# EAGLE design Easy Mikrobus XIAO 230926 (EAGLE 6.5.0)
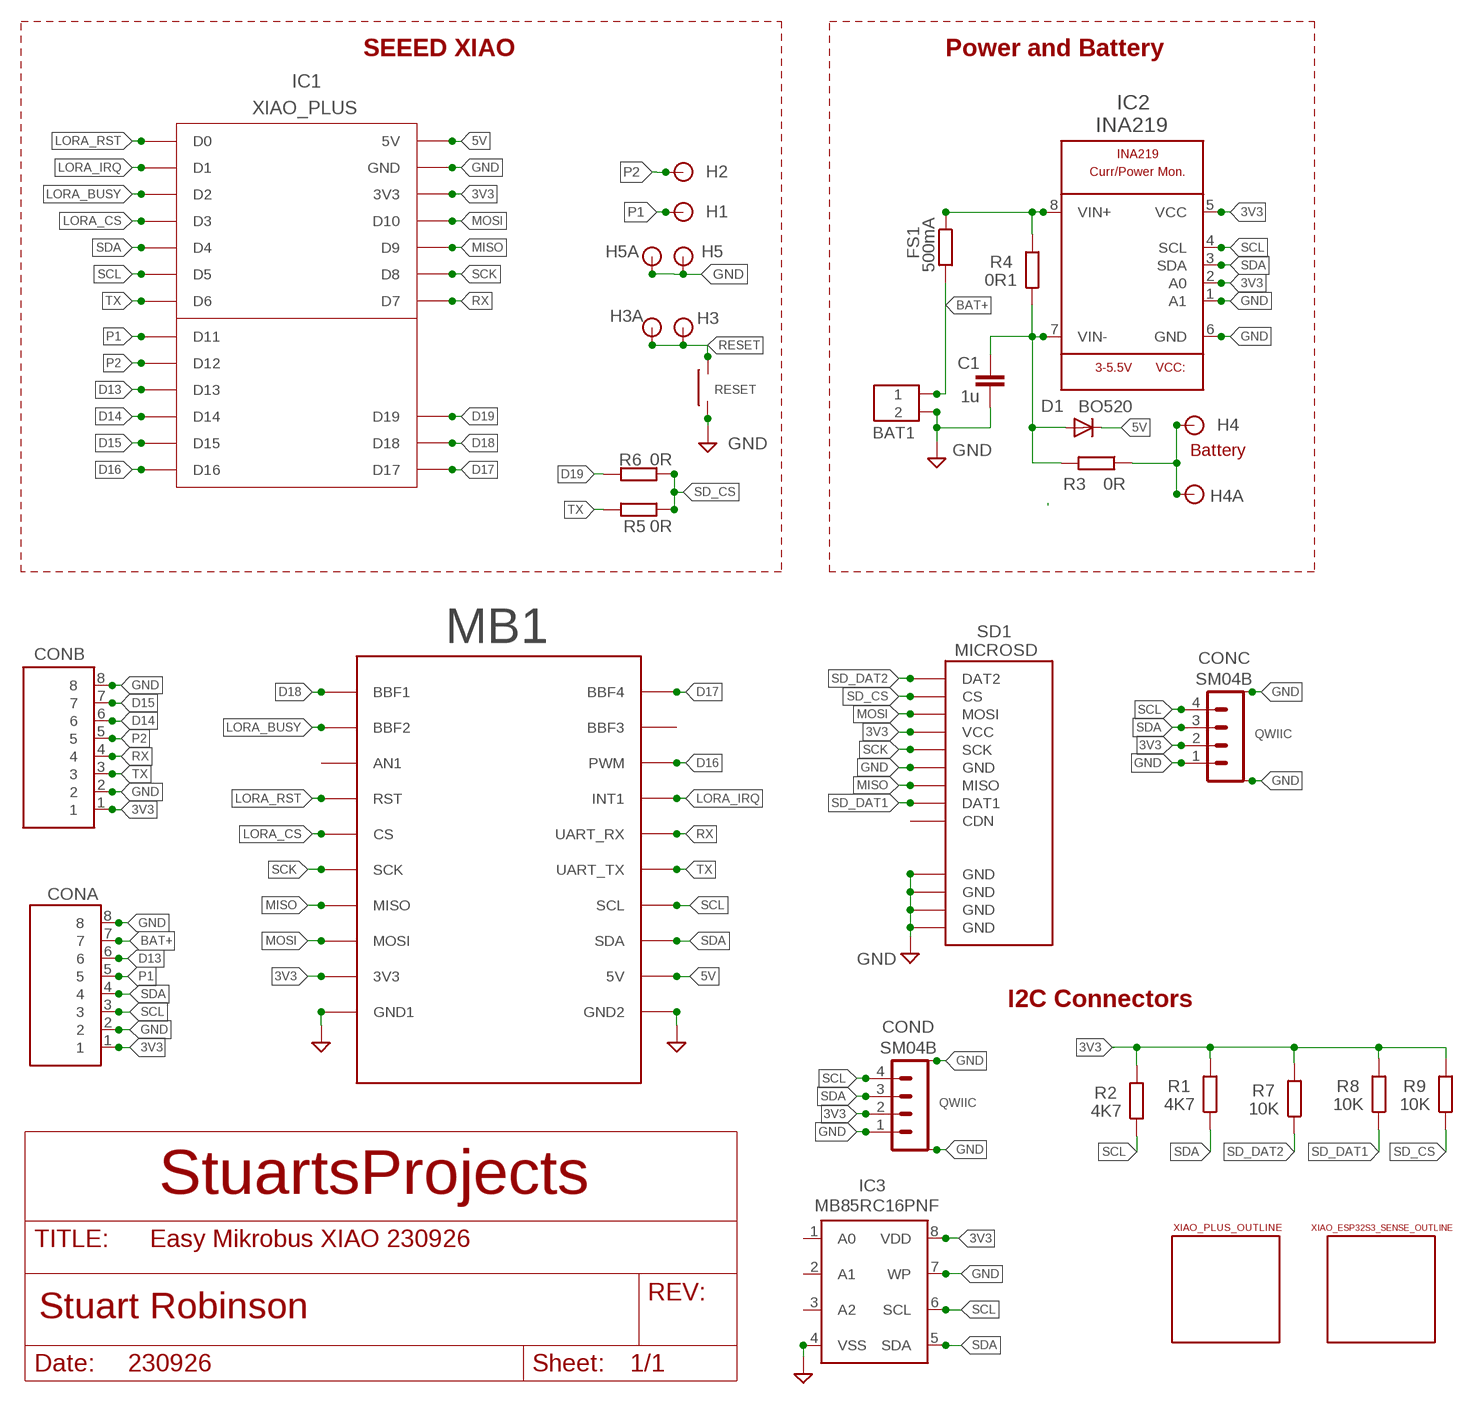
[diagram p0: schematic, sheet 1]

## Parts
BAT1  SCREWTERMINAL_2WAY_0_1_INCH  [SCREWTERMINAL_2WAY_0_1_INCH]
C1  1u  C-EUC1206  [C1206]
CONA  8X1  [8X1]
CONB  8X1  [8X1]
CONC  SM04B  SM04B-SRSS-TB  [SM04B-SRSS-TB]
COND  SM04B  SM04B-SRSS-TB  [SM04B-SRSS-TB]
D1  BO520  DIODE-SOD123  [SOD123]
FS1  500mA  R-EU_R1206  [R1206]
H1  PAD_ROUND_0_8MM_HOLE  [PAD_ROUND_0_8MM_HOLE]
H2  PAD_ROUND_0_8MM_HOLE  [PAD_ROUND_0_8MM_HOLE]
H3  PAD_ROUND_0_8MM_HOLE  [PAD_ROUND_0_8MM_HOLE]
H3A  PAD_ROUND_0_8MM_HOLE  [PAD_ROUND_0_8MM_HOLE]
H4  PAD_ROUND_0_8MM_HOLE  [PAD_ROUND_0_8MM_HOLE]
H4A  PAD_ROUND_0_8MM_HOLE  [PAD_ROUND_0_8MM_HOLE]
H5  PAD_ROUND_0_8MM_HOLE  [PAD_ROUND_0_8MM_HOLE]
H5A  PAD_ROUND_0_8MM_HOLE  [PAD_ROUND_0_8MM_HOLE]
IC1  XIAO_PLUS  PLUS_PIH_DEFAULT  [PLUS_PIH]
IC2  INA219  INA219_SOIC8  [SOIC8]
IC3  MB85RC16PNF  24L256SOIC2  [SOIC_2]
MB1  BBFRIENDY2  [PCB_SOCKET_BBFRIENDLY2]
R1  4K7  R-EU_R1206  [R1206]
R2  4K7  R-EU_R1206  [R1206]
R3  0R  R-EU_R1206  [R1206]
R4  0R1  R-EU_R1206  [R1206]
R5  0R  R-EU_R1206  [R1206]
R6  0R  R-EU_R1206  [R1206]
R7  10K  R-EU_R1206  [R1206]
R8  10K  R-EU_R1206  [R1206]
R9  10K  R-EU_R1206  [R1206]
RESET  SMTSWITCH_4_X_3  [SMTSWITCH_4_X_3]
SD1  MICROSD  MICROSD_PP  [MICROSD_PP]
U$3  ESP32S3_SENSE_OUTLINE_DEFAULT  [ESP32S3_SENSE_OUTLINE]
U$4  PLUS_OUTLINE_ALL  [PLUS_OUTLINE]

## Nets
3V3 [POWER]: CONA.1 CONB.1 CONC.2 COND.2 IC1.3V3.1(3V3) IC1.3V3.2(3V3) IC2.2(A0) IC2.5(VCC) IC3.8(VDD) MB1.3V3 R1.2 R2.2 R7.2 R8.2 R9.2 SD1.VCC
5V [POWER]: D1.C IC1.5V.1(5V) IC1.5V.2(5V) MB1.5V
BAT+ [POWER]: BAT1.P$1 CONA.7 FS1.2
D13: CONA.6 IC1.D13
D14: CONB.6 IC1.D14
D15: CONB.7 IC1.D15
D16: IC1.D16 MB1.PWM
D17: IC1.D17 MB1.BBF4
D18: IC1.D18 MB1.BBF1
D19: IC1.D19 R6.2
GND [POWER]: BAT1.P$2 C1.2 CONA.2 CONA.8 CONB.2 CONB.8 CONC.1 CONC.M1 CONC.M2 COND.1 COND.M1 COND.M2 H5.P$1 H5A.P$1 IC1.GND.1(GND) IC1.GND.2(GND) IC2.1(A1) IC2.6(GND) IC3.4(VSS) IC3.7(WP) MB1.GND1(GND2) MB1.GND2(GND1) RESET.1 SD1.GND SD1.GND@1(GND) SD1.GND@2(GND) SD1.GND@3(GND) SD1.GND@4(GND)
LORA_BUSY: IC1.D2.1(D2) IC1.D2.2(D2) MB1.BBF2
LORA_CS: IC1.D3.1(D3) IC1.D3.2(D3) MB1.CS
LORA_IRQ: IC1.D1.1(D1) IC1.D1.2(D1) MB1.INT(INT1)
LORA_RST: IC1.D0.1(D0) IC1.D0.2(D0) MB1.RST
MISO: IC1.D9.1(D9) IC1.D9.2(D9) MB1.MISO SD1.MISO
MOSI: IC1.D10.1(D10) IC1.D10.2(D10) MB1.MOSI SD1.MOSI
P1: CONA.5 H1.P$1 IC1.D11
P2: CONB.5 H2.P$1 IC1.D12
PIN [POWER]: H4.P$1 H4A.P$1 R3.1
RESET: H3.P$1 H3A.P$1 RESET.2
RX: CONB.4 IC1.D7.1(D7) IC1.D7.2(D7) MB1.RX(UART_RX)
SCK: IC1.D8.1(D8) IC1.D8.2(D8) MB1.SCK SD1.SCK
SCL: CONA.3 CONC.4 COND.4 IC1.D5.1(D5) IC1.D5.2(D5) IC2.4(SCL) IC3.6(SCL) MB1.SCL R2.1
SD_CS: R5.1 R6.1 R9.1 SD1.CS
SD_DAT1: R8.1 SD1.DAT1
SD_DAT2: R7.1 SD1.DAT2
SDA: CONA.4 CONC.3 COND.3 IC1.D4.1(D4) IC1.D4.2(D4) IC2.3(SDA) IC3.5(SDA) MB1.SDA R1.1
TX: CONB.3 IC1.D6.1(D6) IC1.D6.2(D6) MB1.TX(UART_TX) R5.2
VIN [POWER]: C1.1 D1.A IC2.7(VIN-) R3.2 R4.1
VIN+ [POWER]: FS1.1 IC2.8(VIN+) R4.2
Unconnected: IC3.1(A0) IC3.2(A1) IC3.3(A2) MB1.AN1 MB1.BBF3 SD1.CDN

## Notes on the sheet
- Power and Battery
- SEEED XIAO
- Battery
- QWIIC
- I2C Connectors
- QWIIC
- StuartsProjects
- 230926

## Library data of the parts
BAT1 = LMA2:SCREWTERMINAL_2WAY_0_1_INCH
C1 = resistor:C-EU: CAPACITOR, European symbol
CONA CONB = My_Pin_Headers:8X1
CONC COND = con-JST2:SM04B-SRSS: JST SH series header 1.00mm pitch disconnectable crimp style connectors, horizontal (side entry type), 4 pins
D1 = diode:DIODE-: DIODE
FS1 R1-R9 = resistor:R-EU_: RESISTOR, European symbol
H1-H3 H3A H4 H4A H5 H5A = pads:PAD_ROUND
IC1 = Seeed-Studio-XIAO-ESP32S3-footprint-eagle2:PLUS_PIH
IC2 = INA219:INA219: INA219 - I2C Current/Power Monitor Voltage Range: 0-26V Accuracy: 0.5% Temperature: -40°C - 125°C Check availability <https://pricing.snapeda.com/parts/INA219/Texas%20Instruments/view-part?ref=eda>
IC3 = LMA2:24L256
MB1 = My_Mikrobus:BBFRIENDY2
RESET = LMA2:SMTSWITCH_4_X_3
SD1 = DE1594-v2:MICROSD_PP
U$3 = XIAO_Stuarts:ESP32S3_SENSE_OUTLINE
U$4 = XIAO_Stuarts:PLUS_OUTLINE

## Net classes
0 default: width 0.152 mm
1 POWER: width 0.635 mm
2 VDD: width 0.635 mm

## Board
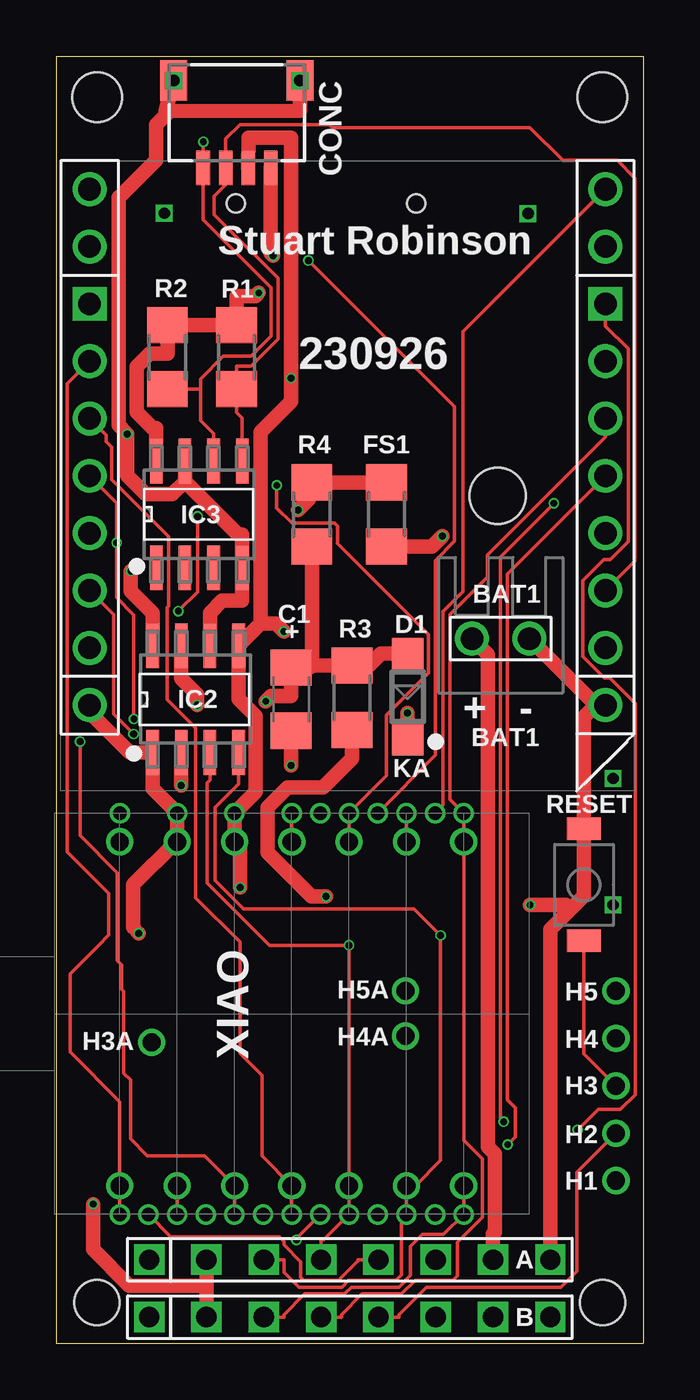
[diagram p1: board, top side]
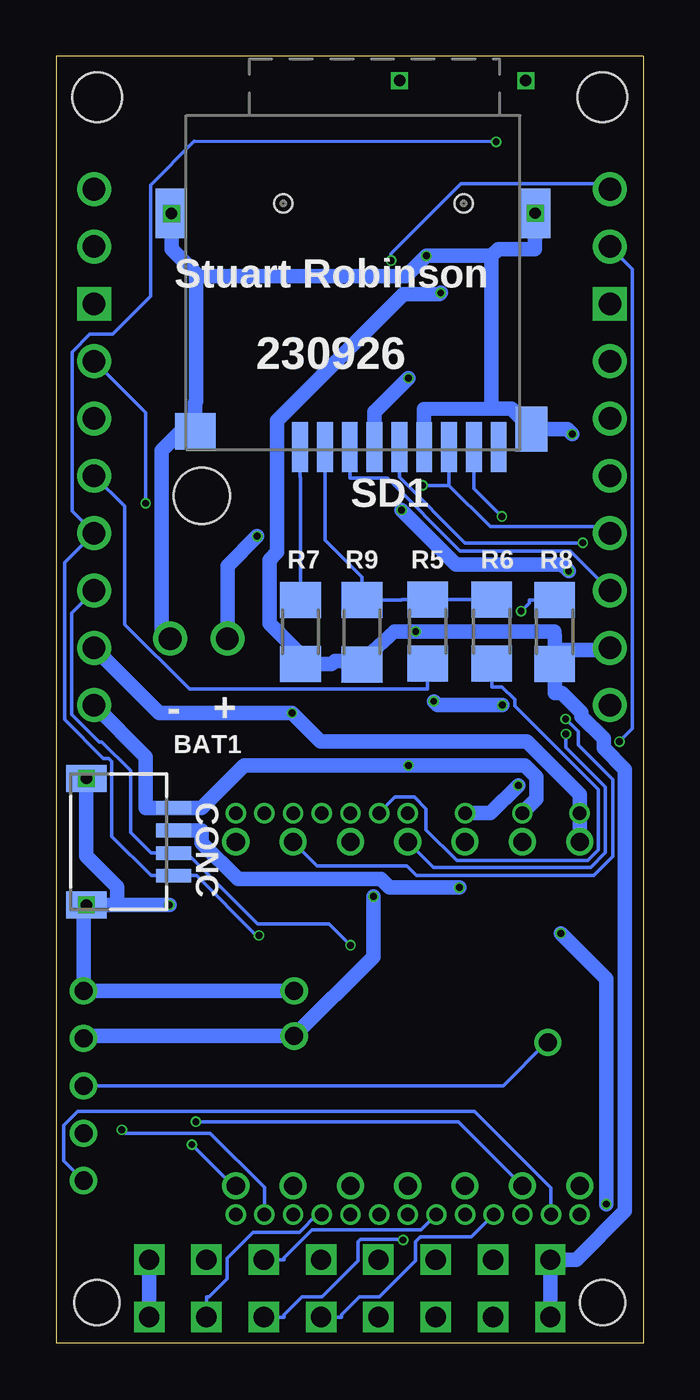
[diagram p2: board, bottom side, seen from below]

Size 26 x 57 mm. Coordinates in mm from the lower left corner, seen from the top.
Outline: 0,0 26,0 26,57 0,57 0,0
Copper layers (1*16): Top 0.035559375mm / dielectric 1.6mm / Bottom 0.035559375mm
Design rules "jlcpcb2layer_Stuarts": minimum track width 5mil, minimum drill 12mil, track to track 6mil, track to pad 6mil, pad to pad 6mil, via to via 6mil, smd to smd 6mil, copper to edge 8mil, drill to drill 6mil, minimum pad ring 5mil, minimum via ring 3mil, stop-mask expansion 2.5mil, vias tented up to drill 1000mil, thermal gap 10mil
Holes 2.2 mm at 1.8,55.2 24.2,55.2
Holes 2 mm at 1.8,1.8 24.2,1.8
Holes 2.5 mm at 19.55,37.54
tRestrict: area 14.8,7.9 to 16.5,8.6; area 14.2,14.7 to 16.8,16.6; area 14.8,20.6 to 16.5,21.3; area 14.2,12.6 to 16.8,14.6; area 7.5,8.9 to 8.8,11.4; area 9.4,8.9 to 10.7,11.4; area 3.8,18.2 to 6.3,19.6; area 3.8,9.6 to 6.2,10.9; area -0.3,18.2 to 2.1,19.6; area -0.3,9.6 to 2.1,11; area 8.5,12.5 to 10.1,14.2; area 5.9,12.5 to 7.6,14.2; area 8.5,15.1 to 10.1,16.7; area 5.9,15 to 7.6,16.7; area 3.4,15 to 5,16.7; area 0.9,12.5 to 2.5,14.2; area 3.4,12.5 to 5,14.2; area 0.9,15 to 2.5,16.7; area 4.1,17.1 to 4.9,17.9; area 4.1,11.3 to 4.9,12.1; area -0.6,52.8 to 4.2,57.6; area 21.9,52.9 to 26.7,57.6

### Footprints (pad centres in the part's own frame; a part is rotated, then mirrored left to right if it is on the bottom)
SCREWTERMINAL_2WAY_0_1_INCH = drill 1: P$1 -1.27,0; P$2 1.27,0
C1206 = smd 1.6 x 1.8: 1 -1.4,0; 2 1.4,0
8X1 = drill 0.9 square: 1 -8.89,0; 2 -6.35,0; 3 -3.81,0; 4 -1.27,0; 5 1.27,0; 6 3.81,0; 7 6.35,0; 8 8.89,0
SM04B-SRSS-TB = smd 0.6 x 1.55: 1 1.5,0; 2 0.5,0; 3 -0.5,0; 4 -1.5,0 | smd 1.2 x 1.8: M1 2.8,3.875; M2 -2.8,3.875
SOD123 = smd 1.4 x 1.4: A 1.9,0; C -1.9,0
R1206 = smd 1.6 x 1.803: 1 -1.422,0; 2 1.422,0
PAD_ROUND_0_8MM_HOLE = drill 0.8: P$1 0,0
PLUS_PIH = drill 0.6 pad 0.9: 3V3.1 8.89,2.54; 5V.1 8.89,7.62; D0.1 -8.89,7.62; D1.1 -8.89,5.08; D2.1 -8.89,2.54; D3.1 -8.89,0; D4.1 -8.89,-2.54; D5.1 -8.89,-5.08; D6.1 -8.89,-7.62; D7.1 8.89,-7.62; D8.1 8.89,-5.08; D9.1 8.89,-2.54; D10.1 8.89,0; D11 -8.89,6.35; D12 -8.89,3.81; D13 -8.89,1.27; D14 -8.89,-1.27; D15 -8.89,-3.81; D16 -8.89,-6.35; D17 8.89,-6.35; D18 8.89,-3.81; D19 8.89,-1.27; GND.1 8.89,5.08 | drill 0.8: 3V3.2 7.62,2.54; 5V.2 7.62,7.62; D0.2 -7.62,7.62; D1.2 -7.62,5.08; D2.2 -7.62,2.54; D3.2 -7.62,0; D4.2 -7.62,-2.54; D5.2 -7.62,-5.08; D6.2 -7.62,-7.62; D7.2 7.62,-7.62; D8.2 7.62,-5.08; D9.2 7.62,-2.54; D10.2 7.62,0; GND.2 7.62,5.08
SOIC8 = smd 1.981 x 0.559: 1 -2.362,1.905; 2 -2.362,0.635; 3 -2.362,-0.635; 4 -2.362,-1.905; 5 2.362,-1.905; 6 2.362,-0.635; 7 2.362,0.635; 8 2.362,1.905
SOIC_2 = smd 1.981 x 0.559: 1 -2.362,1.905; 2 -2.362,0.635; 3 -2.362,-0.635; 4 -2.362,-1.905; 5 2.362,-1.905; 6 2.362,-0.635; 7 2.362,0.635; 8 2.362,1.905
PCB_SOCKET_BBFRIENDLY2 = drill 1: 3V3 -11.43,5.08; 5V 11.43,5.08; BBF1 -11.43,25.4; BBF2 -11.43,22.86; BBF3 11.43,22.86; BBF4 11.43,25.4; CS -11.43,15.24; GND1 -11.43,2.54; GND2 11.43,2.54; INT 11.43,17.78; MISO -11.43,10.16; MOSI -11.43,7.62; RST -11.43,17.78; RX 11.43,15.24; SCK -11.43,12.7; SCL 11.43,10.16; SDA 11.43,7.62; TX 11.43,12.7 | drill 1 square: AN1 -11.43,20.32; PWM 11.43,20.32
SMTSWITCH_4_X_3 = smd 1 x 1.5: 1 -2.48,0; 2 2.48,0
MICROSD_PP = smd 2.2 x 0.7: CDN -0.2,-4.95; CS -0.2,2.75; DAT1 -0.2,-3.85; DAT2 -0.2,3.85; GND -0.2,-1.65; MISO -0.2,-2.75; MOSI -0.2,1.65; SCK -0.2,-0.55; VCC -0.2,0.55 | smd 1.6 x 1.8: GND@1 0.5,8.5 | smd 2.2 x 1.4: GND@2 10.15,9.55; GND@4 10.15,-6.55 | smd 2 x 1.4: GND@3 0.6,-6.4 | hole 0.8: 10.6,4.6; 10.6,-3.4

### Placement (x,y rotation side)
BAT1  19.69,31.21 0 top
C1  10.4,28.53 270 top
CONA  13,3.69 0 top
CONB  13,1.15 0 top
CONC  20.8,22.21 90 bottom
COND  8,52.06 0 top
D1  15.56,28.64 90 top
FS1  14.63,36.71 270 top
H1  24.8,7.2 90 top
H2  24.8,9.3 90 top
H3  24.8,11.4 90 top
H3A  4.22,13.33 0 top
H4  24.8,13.5 90 top
H4A  15.46,13.6 0 top
H5  24.8,15.6 90 top
H5A  15.46,15.6 0 top
IC1  10.43,14.59 90 top
IC2  6.17,28.53 90 top
IC3  6.33,36.71 90 top
MB1  12.9,25.72 0 top
R1  7.98,43.68 90 top
R2  4.92,43.68 90 top
R3  13.1,28.59 90 top
R4  11.32,36.71 90 top
R5  9.55,31.52 270 bottom
R6  6.71,31.52 270 bottom
R7  15.18,31.5 270 bottom
R8  3.92,31.5 270 bottom
R9  12.46,31.49 270 bottom
RESET  23.38,20.3 270 top
SD1  11.35,39.89 90 bottom
U$3  51.58,33.89 0 top  (outside the outline)
U$4  31.12,33.72 0 top  (outside the outline)

### Tracks (layer width: path | path; a pad name or v marks a point on that pad's centre or on a via)
3V3  (via drill 0.3, 0.3 pad 0.46)
  Top 0.635: 9.05,31.87 IC2.5 8.07,28.52 8.82,27.77 8.82,24.41 IC1.3V3.1 IC1.3V3.2 8.15,21.95 v8.15,20.18 | 9.05,31.87 9.05,40.36 10.4,41.7 v10.4,42.75 10.4,52.54 10.39,53.4 8.51,53.4 COND.2 | IC2.2 v5.54,24.71 | IC3.8 4.42,40.53 4.25,40.53 3.55,41.24 3.55,43.25 4.13,43.83 4.92,43.83 R2.2 6.61,45.1 R1.2 7.98,46.37 8.81,46.37 v8.97,46.52 | 9.05,31.87 9.73,31.87 v10.08,31.53
  Bottom 0.635: SD1.VCC 11.9,41.26 11.89,41.26 v10.4,42.75 | v8.15,20.18 11.23,20.18 11.62,20.57 17.96,20.57 19.55,22.17 19.55,22.71 CONC.2 | IC1.3V3.1 6.76,23.48 v5.54,24.71 | 3.92,30.71 1.56,30.71 MB1.3V3 | 3.92,30.71 3.91,31.3 3.94,31.53 v10.08,31.53 | 3.92,30.71 R8.2 3.92,28.81 3.61,28.81 2.73,27.94 2.73,27.77 1.75,26.78 1.75,26.36 0.81,25.42 0.81,5.85 2.96,3.69 CONA.1 CONB.1 | 12.46,30.23 11.01,31.53 10.14,31.53 | 10.14,31.53 v10.08,31.53 | 12.46,30.23 13.66,30.23 13.81,30.08 14.49,30.08 | v8.97,46.52 9.02,46.47 10.61,46.47 16.21,40.87 16.21,35.04 16.55,34.7 16.55,31.87 14.76,30.08 14.49,30.08 | R7.2 14.49,30.08 | R9.2 12.46,30.23 | v10.08,31.53 10.14,31.53
5V  (via drill 0.3 pad 0.46)
  Top 0.635: D1.C v15.56,27.91
  Bottom 0.635: IC1.5V.2 IC1.5V.1 2.81,24.31 5.15,26.64 14.29,26.64 v15.56,27.91 21.44,27.91 MB1.5V
BAT+  (via drill 0.3 pad 0.46)
  Top 0.635: BAT1.P$1 19.12,30.51 19.12,8.68 19.43,8.38 19.43,4.91 19.35,4.83 CONA.7 | FS1.2 16.64,35.29 v17.1,35.74
  Bottom 0.635: v17.1,35.74 18.42,34.42 BAT1.P$1
D13
  Bottom 0.152: CONA.6 15.91,3.69 15.91,3.79 14.67,5.02 9.84,5.02 IC1.D13
D14  (via drill 0.3 pad 0.46)
  Top 0.152: IC1.D14 10.63,4.63 v10.63,4.56
  Bottom 0.152: CONB.6 15.91,1.15 15.91,1.26 15.12,2.05 14.22,2.05 12.63,3.64 12.63,4.49 12.53,4.59 10.67,4.59 v10.63,4.56
D15
  Bottom 0.152: IC1.D15 14.44,5.7 15.22,4.92 17.28,4.92 18.45,3.75 18.45,2.84 19.24,2.05 19.35,2.05 CONB.7
D16  (via drill 0.3 pad 0.46)
  Top 0.152: MB1.PWM 24.33,45.06 25.34,44.05 25.34,35.5 24.55,34.72 24.27,34.72 23.33,33.78 23.33,30.42 24.28,29.47 24.52,29.47 25.65,28.34 25.65,11 25,10.35 24.01,10.35 v23.1,9.45
  Bottom 0.152: v23.1,9.45 22.96,9.3 19.18,9.3 16.78,6.9 IC1.D16
D17
  Top 0.152: IC1.D17 17.13,23.83 17.13,32.42 18.01,33.29 18.01,44.8 MB1.BBF4
D18  (via drill 0.3 pad 0.46)
  Top 0.152: v11.17,47.96 17.65,41.48 17.65,35.52 16.8,34.67 16.8,26.04 IC1.D18
  Bottom 0.152: MB1.BBF1 1.72,51.37 8.07,51.37 11.17,48.27 v11.17,47.96
D19
  Bottom 0.152: IC1.D19 10.99,24.19 10.14,24.19 9.61,23.66 9.61,22.74 8.25,21.38 2.45,21.38 1.97,21.85 1.97,24.52 5.68,28.23 5.68,28.5 6.25,29.07 6.71,29.07 R6.2
GND  (via drill 0.3 pad 0.46, 0.5 pad 0.46)
  Top 0.152: COND.M2 v5.2,55.93 | COND.M1 v10.79,55.93
  Top 0.635: 5.7,38.17 8.06,35.81 8.23,35.81 IC3.4 8.23,32.89 7.34,32.89 6.8,32.35 IC2.6 | 5.7,38.17 5.7,38.2 IC3.7 | 5.7,38.17 5.13,37.61 3.95,37.61 3.14,38.42 v3.14,40.27 2.75,40.67 2.75,50.76 2.78,50.76 4.43,52.41 4.43,53.98 5.01,54.56 | 5.01,54.56 4.84,54.56 COND.M2 | 5.01,54.56 10.8,54.59 COND.M1 | C1.2 v10.4,25.59 | MB1.GND1 1.47,27.94 3.25,26.17 IC2.1 4.26,24.57 IC1.GND.1 IC1.GND.2 5.3,22.21 3.4,20.31 3.4,18.41 v3.65,18.16 | 23.91,28.26 BAT1.P$2 | 6.65,2.54 3.22,2.54 1.63,4.14 v1.63,6.16 | CONB.2 6.65,2.54 | CONA.8 21.89,4.83 21.89,18.33 22.78,19.21 | 22.78,19.21 23.36,19.8 23.38,19.82 23.38,21.81 RESET.1 23.38,27.73 23.91,28.26 | 23.91,28.26 MB1.GND2 | CONA.2 6.65,2.54 | 22.78,19.21 22.58,19.41 v20.99,19.41 | v9.61,48.17 9.5,48.27 COND.1
  Bottom 0.152: CONC.M2 v24.67,19.41 | CONC.M1 v24.67,25.01 | SD1.GND@4 v4.78,50.06
  Bottom 0.635: v3.14,40.27 3.36,40.49 SD1.GND@3 5.83,41.39 6.73,41.39 | 6.73,41.39 9.71,41.37 SD1.GND | 6.72,48.17 6.73,41.39 | 6.72,48.17 6.42,48.47 4.8,48.47 SD1.GND@4 | 6.72,48.17 v9.61,48.17 10.51,47.26 19.81,47.26 | 19.81,47.26 19.81,47.38 20.9,48.47 SD1.GND@2 | 19.81,47.26 19.81,41.7 19.85,41.66 19.85,41.02 | MB1.GND2 22.05,25.98 22.05,23.71 CONC.1 19.55,23.71 17.68,25.59 v10.4,25.59 5.24,25.59 4.73,25.07 4.73,24.1 IC1.GND.1 | v1.63,6.16 1.63,16.13 v3.65,18.16 | CONC.M2 v24.67,19.41 | v24.67,19.41 23.3,19.41 | 23.3,19.41 23.3,20.21 24.68,21.58 CONC.M1 | H5A.P$1 H5.P$1 24.8,19.29 CONC.M2 | CONA.8 CONB.8 | 19.85,41.02 21.34,39.54 21.34,31.59 BAT1.P$2 | SD1.GND@1 19.85,41.02 | v20.99,19.41 23.3,19.41 | 23.3,19.41 v24.67,19.41 | v24.67,19.41 CONC.M2
  other vias: 20.9,50.04
LORA_BUSY  (via drill 0.3 pad 0.46)
  Top 0.152: v1.05,26.65 1.05,22.48 2.7,20.83 2.7,20.06 2.7,16.95 2.9,16.75 2.9,15.67 2.99,15.58 2.99,11.94 3.28,11.65 3.28,9.05 4.03,8.3 6.56,8.3 IC1.D2.2 IC1.D2.1
  Bottom 0.152: MB1.BBF2 0.48,47.59 0.48,27.22 v1.05,26.65
LORA_CS
  Top 0.152: MB1.CS 2.21,40.22 | 2.21,40.22 | 2.21,40.22 | 2.21,40.22 2.21,39.94 2.45,39.7 2.45,38.26 4.98,35.73 4.98,32.64 4.91,32.58 4.91,28.52 6.18,27.25 6.18,19.72 8.14,17.76 8.14,12.84 9.11,11.87 9.11,8.29 IC1.D3.2 IC1.D3.1
LORA_IRQ  (via drill 0.3 pad 0.46)
  Top 0.152: v22.04,37.2 19.67,34.82 19.67,9.96 v19.82,9.81 | IC1.D1.1 IC1.D1.2
  Bottom 0.152: IC1.D1.2 8.19,9.81 v19.82,9.81 | v19.82,9.81 | MB1.INT 22.04,41.21 v22.04,37.2
LORA_RST
  Top 0.152: MB1.RST 0.48,42.51 0.48,21.76 1.84,20.4 2.32,19.92 2.32,18.08 1.84,17.6 1.84,17.59 0.61,16.36 0.61,12.89 2.81,10.69 IC1.D0.2 IC1.D0.1
MISO  (via drill 0.3 pad 0.46)
  Top 0.152: v9.77,38 9.77,37 10.45,36.32 12.33,36.32 12.45,36.2 12.45,35.43 16.49,31.39 16.49,29.69 14.63,27.83 14.63,25.14 IC1.D9.1 IC1.D9.2
  Bottom 0.152: 8.6,38 8.6,38.44 SD1.MISO | MB1.MISO 1.75,36.16 6.77,36.16 8.6,38 | 8.6,38 v9.77,38
MOSI  (via drill 0.3 pad 0.46)
  Top 0.152: MB1.MOSI 2.54,32.27 2.54,27.86 v3.42,26.98 | IC1.D10.2 IC1.D10.1
  Bottom 0.152: IC1.D10.2 9.29,21.07 2.32,21.07 1.67,21.73 1.67,24.64 3.42,26.39 v3.42,26.98 | SD1.MOSI 13,38.31 11.34,38.31 8.11,35.08 3.21,35.08 MB1.MOSI
P1
  Top 0.152: CONA.5 13.37,3.69 13.37,3.65 12.5,2.79 10.96,2.79 10.83,2.92 10.83,3.61 10.09,4.34 10.09,4.5 9.88,4.71 5.07,4.71 IC1.D11
  Bottom 0.152: IC1.D11 | IC1.D11 4.08,6.88 7.47,10.27 25.06,10.27 25.67,9.65 25.67,8.07 H1.P$1
P2
  Top 0.152: H2.P$1 23.06,7.56 23.06,3.18 22.36,2.48 16.39,2.48 15.17,1.26 15.17,1.15 CONB.5
  Bottom 0.152: CONB.5 13.37,1.15 13.37,1.26 12.58,2.05 11.68,2.05 10.09,3.64 10.09,4.5 9.87,4.72 7.6,4.72 IC1.D12
PIN  (via drill 0.3 pad 0.46)
  Top 0.635: R3.1 13.1,25.9 11.81,24.61 10.24,24.61 9.36,23.73 9.36,21.73 11.31,19.78 v11.95,19.78
  Bottom 0.635: H4.P$1 24.7,13.6 H4A.P$1 11.95,17.11 v11.95,19.78
RESET
  Top 0.152: RESET.2 23.38,12.82 H3.P$1
  Bottom 0.152: H3.P$1 6.2,11.4 4.3,13.3 H3A.P$1
RX
  Top 0.152: MB1.RX 24.33,40.14 19.09,34.9 19.09,33.94 17.44,32.29 17.44,24.09 IC1.D7.1 IC1.D7.2 18.05,8.98 18.88,8.15 18.88,5.57 17.77,4.46 | 17.77,4.46 | 17.77,4.46 17.77,2.98 17.58,2.79 15.91,2.79 15.3,2.18 13.55,2.18 12.63,1.26 12.63,1.15 CONB.4
SCK  (via drill 0.3 pad 0.46)
  Top 0.152: v3.43,27.65 3.43,32.26 2.67,33.02 v2.67,35.45 2.67,37.22 MB1.SCK | IC1.D8.1 IC1.D8.2
  Bottom 0.152: v3.43,27.65 2.88,27.09 2.88,26.5 1.35,24.98 1.35,21.56 2.18,20.73 10.04,20.73 10.45,21.14 14.44,21.14 IC1.D8.2 | v2.67,35.45 7.89,35.45 10.8,38.36 SD1.SCK
SCL  (via drill 0.3 pad 0.46)
  Top 0.152: 6.38,42.26 6.38,42.71 7.38,43.72 8.62,43.72 9.51,44.61 9.51,46.75 6.5,49.78 6.5,49.86 COND.4 | 6.38,42.26 6.38,40.88 6.96,40.29 IC3.6 | R2.1 6.38,42.26 | IC2.4 8.07,24.76 7.03,23.72 7.03,20.5 8.3,19.23 15.85,19.23 v17.02,18.06 17.02,8.09 15.91,6.97 IC1.D5.2 IC1.D5.1 15.28,5.47 15.28,3.02 15.04,2.79 12.95,2.79 12.65,2.48 10.76,2.48 10.09,3.15 10.09,3.69 CONA.3 | v6.51,53.22 v6.5,53.2 COND.4 | COND.4 6.46,52.02
  Bottom 0.152: v6.51,53.22 19.9,53.23 21.83,51.3 21.83,46.37 23.52,44.69 24.52,44.69 25.31,43.91 25.31,36.86 MB1.SCL 25.64,34.57 25.64,27.62 23.93,25.91 23.69,25.91 23.55,25.76 23.55,22.45 21.8,20.71 CONC.4 19.8,20.71 17.15,18.06 v17.02,18.06
SD_CS
  Bottom 0.152: SD1.CS 14.1,35.58 12.46,33.94 R9.1 10.71,32.91 10.68,32.94 R5.1 R6.1
SD_DAT1  (via drill 0.3 pad 0.46)
  Top 0.152: v5.4,32.42 6.26,33.28 v6.26,36.62
  Bottom 0.152: SD1.DAT1 7.5,37.86 v6.26,36.62 | v5.4,32.42 5.05,32.78 5.05,32.92 R8.1
SD_DAT2
  Bottom 0.152: SD1.DAT2 15.2,38.36 15.18,38.34 R7.1
SDA  (via drill 0.3 pad 0.46)
  Top 0.152: COND.3 7.5,53.35 8.13,53.98 8.41,53.98 | MB1.SDA 25.64,34.65 25.64,51.23 25.64,51.61 24.85,52.4 22.44,52.4 20.99,53.85 12.24,53.85 12.11,53.98 8.89,53.98 | IC3.5 8.23,40.97 7.98,41.23 R1.1 7.98,43.29 8.62,43.29 9.82,44.48 9.82,47.17 7.48,49.51 6.99,50 6.99,50.8 7.5,51.31 COND.3 | CONA.4 11.73,4.59 11.86,4.59 IC1.D4.1 IC1.D4.2 v12.97,17.62 9.44,17.62 6.68,20.38 6.68,24.82 6.8,24.95 IC2.3 | 8.41,53.98 8.7,53.98 8.89,53.98 | 8.41,53.98 8.89,53.98 | COND.3 7.48,52.04
  Bottom 0.152: MB1.SDA 25.33,32.34 25.33,27.85 24.11,26.63 23.98,26.63 22.72,25.37 22.72,22.62 21.8,21.71 CONC.3 20.23,21.71 17.08,18.56 13.91,18.56 v12.97,17.62
TX  (via drill 0.3 pad 0.46)
  Top 0.152: MB1.TX 19.98,34.07 19.98,10.78 20.34,10.43 20.34,9.13 v20,8.79 | CONB.3 10.09,1.15 10.09,1.26 11.01,2.18 12.78,2.18 13.08,2.48 15.17,2.48 15.69,3 15.69,4.28 16.22,4.81 17.16,4.81 IC1.D6.1 IC1.D6.2
  Bottom 0.152: v20,8.79 18.18,6.97 IC1.D6.2 | R5.2 9.55,29.07 9.56,28.98 20.09,28.97 22.98,31.84 22.98,37.07 MB1.TX
VIN  (via drill 0.3 pad 0.46)
  Top 0.635: IC2.7 5.54,29.43 6.24,28.73 v6.24,28.26 | v9.28,28.43 9.51,28.66 10.4,28.66 C1.1 11.24,29.93 11.32,30.01 | 11.32,30.01 11.32,34.02 R4.1 | 11.32,30.01 11.73,30.01 R3.2 13.86,30.01 14.39,30.54 D1.A
  Bottom 0.635: v6.24,28.26 9.11,28.26 v9.28,28.43
VIN+  (via drill 0.3 pad 0.46)
  Top 0.635: v10.7,36.9 11.2,37.4 11.2,37.9 R4.2 13.26,38.13 FS1.1 | IC2.8 4.26,32.35 3.3,33.32 v3.3,34.2
  Bottom 0.635: v3.3,34.2 3.6,34.5 8.3,34.5 v10.7,36.9

### Text on the board
tPlace: Stuart Robinson | 230926 | + | + | - | KA | A | B
bPlace: Stuart Robinson | 230926 | + | -
tNames: CONC | R2 | R1 | R4 | FS1 | IC3 | BAT1 | C1 | R3 | D1 | IC2 | BAT1 | RESET | H5A | H5 | H3A | XIAO | H4A | H4 | H3 | H2 | H1
bNames: SD1 | R8 | R6 | R5 | R9 | R7 | BAT1 | CONC